# Altium schematic sheet Connector miniPCIe.SchDoc
size A3
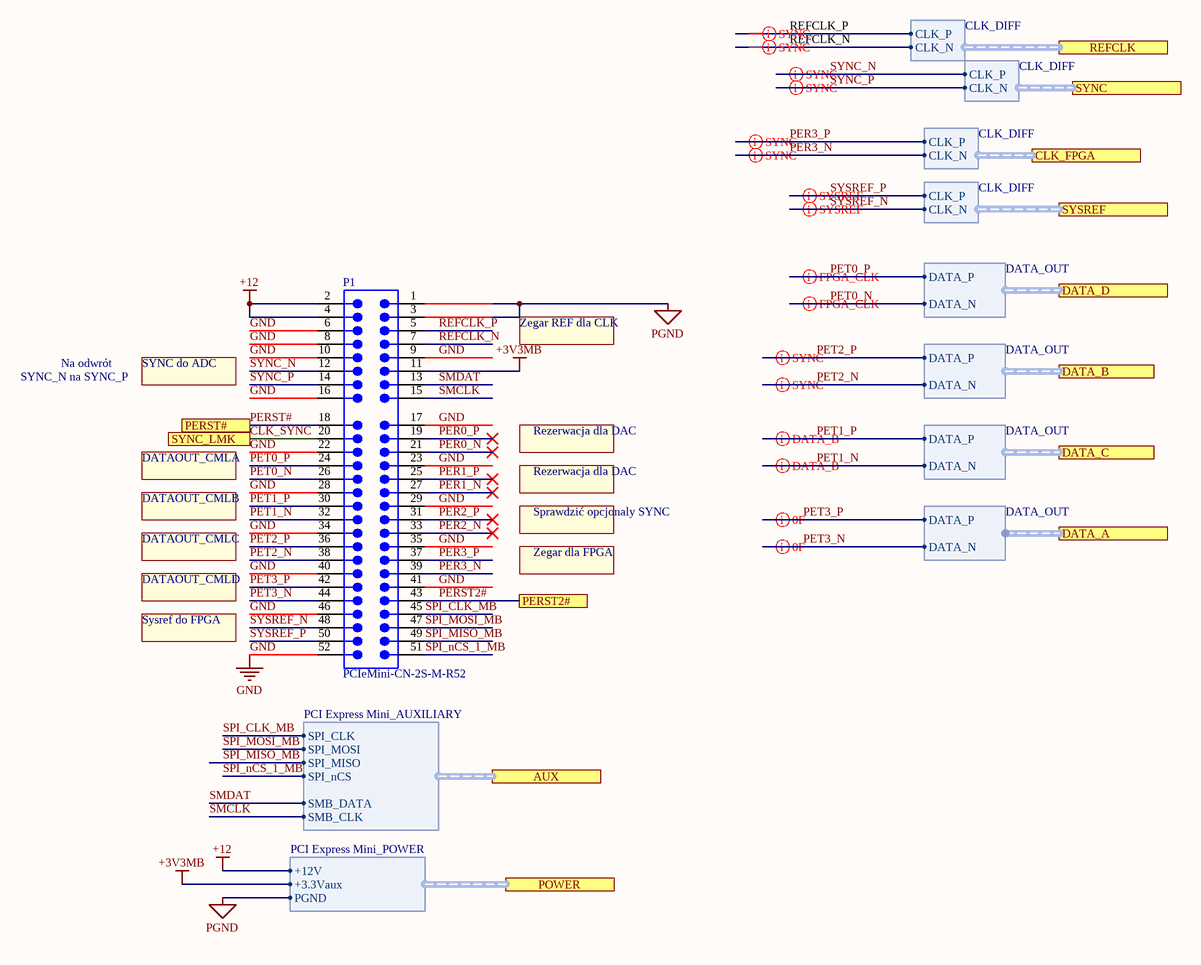
[diagram p0: Connector miniPCIe.SchDoc]

## Parts
P1  PCIeMini-CN-2S-M-R52  [PCIeMini-GF-2D-800-1K-S52]  (no BOM)

## Ports
AUX (harness PCI Express Mini_AUXILIARY), CLK_FPGA (harness CLK_DIFF), DATA_A (harness DATA_OUT), DATA_B (harness DATA_OUT), DATA_C (harness DATA_OUT), DATA_D (harness DATA_OUT), PERST2#, PERST#, POWER (harness PCI Express Mini_POWER), REFCLK (harness CLK_DIFF), SYNC (harness CLK_DIFF), SYNC_LMK, SYSREF (harness CLK_DIFF)

## Harnesses
PCI Express Mini_POWER: +3.3Vaux, PGND, +12V
PCI Express Mini_AUXILIARY: SMB_DATA, SMB_CLK, SPI_nCS, SPI_MISO, SPI_MOSI, SPI_CLK
DATA_OUT: DATA_P, DATA_N
CLK_DIFF: CLK_P, CLK_N

## Nets
+3V3MB: P1.11 ; port POWER.+3.3Vaux
+12: P1.2 P1.4 ; port POWER.+12V
GND: P1.6 P1.8 P1.9 P1.10 P1.16 P1.17 P1.22 P1.23 P1.28 P1.29 P1.34 P1.35 P1.40 P1.41 P1.46 P1.52
PGND: P1.1 P1.3 ; port POWER.PGND
CLK_SYNC: P1.20 ; port SYNC_LMK
PER0_N: P1.21
PER0_P: P1.19
PER1_N: P1.27
PER1_P: P1.25
PER2_N: P1.33
PER2_P: P1.31
PER3_N: P1.39 ; port CLK_FPGA.CLK_N
PER3_P: P1.37 ; port CLK_FPGA.CLK_P
PERST2#: P1.43 ; port PERST2#
PERST#: P1.18 ; port PERST#
PET0_N: P1.26 ; port DATA_D.DATA_N
PET0_P: P1.24 ; port DATA_D.DATA_P
PET1_N: P1.32 ; port DATA_C.DATA_N
PET1_P: P1.30 ; port DATA_C.DATA_P
PET2_N: P1.38 ; port DATA_B.DATA_N
PET2_P: P1.36 ; port DATA_B.DATA_P
PET3_N: P1.44 ; port DATA_A.DATA_N
PET3_P: P1.42 ; port DATA_A.DATA_P
REFCLK_N: P1.7 ; port REFCLK.CLK_N
REFCLK_P: P1.5 ; port REFCLK.CLK_P
SMCLK: P1.15 ; port AUX.SMB_CLK
SMDAT: P1.13 ; port AUX.SMB_DATA
SPI_CLK_MB: P1.45 ; port AUX.SPI_CLK
SPI_MISO_MB: P1.49 ; port AUX.SPI_MISO
SPI_MOSI_MB: P1.47 ; port AUX.SPI_MOSI
SPI_nCS_1_MB: P1.51 ; port AUX.SPI_nCS
SYNC_N: P1.12 ; port SYNC.CLK_P
SYNC_P: P1.14 ; port SYNC.CLK_N
SYSREF_N: P1.48 ; port SYSREF.CLK_N
SYSREF_P: P1.50 ; port SYSREF.CLK_P

## Layout directives
differential pair; differential pair class DIFF_100: PER3_N, PER3_P, PET0_N, PET0_P, PET1_N, PET1_P, PET2_N, PET2_P, PET3_N, PET3_P, REFCLK_N, REFCLK_P, SYNC_N, SYNC_P, SYSREF_N, SYSREF_P

## Notes on the sheet
- SYNC_N na SYNC_P
- Na odwrót
- SYNC do ADC
- Zegar REF dla CLK
- Rezerwacja dla DAC
- DATAOUT_CMLA
- DATAOUT_CMLB
- Sprawdzić opcjonaly SYNC
- DATAOUT_CMLC
- DATAOUT_CMLD
- Zegar dla FPGA
- Sysref do FPGA
- Title
- Size:
- Date:
- A3
- Number:
- Time:
- Revision:
- Sheet
- of
- File:

## Library data of the parts
P1 = CMP-0001-00067-2: Golden finger, PCIeMini, Dual, Staggered, Pitch 0.8mm, 52-Position; Mating Connector: Tyco-292443-1; Package Version: rev1.2, Oct-2007; Publisher: Altium; Package Reference: PCIeMini-GF-2D-800-1K-S52; ClassName: Edge Connector; Datasheet Version: Revision 1.2 Oct-2007